# Altium schematic sheet Driver_1.SchDoc
size A4; SheetNumber: 2; SheetTotal: 7
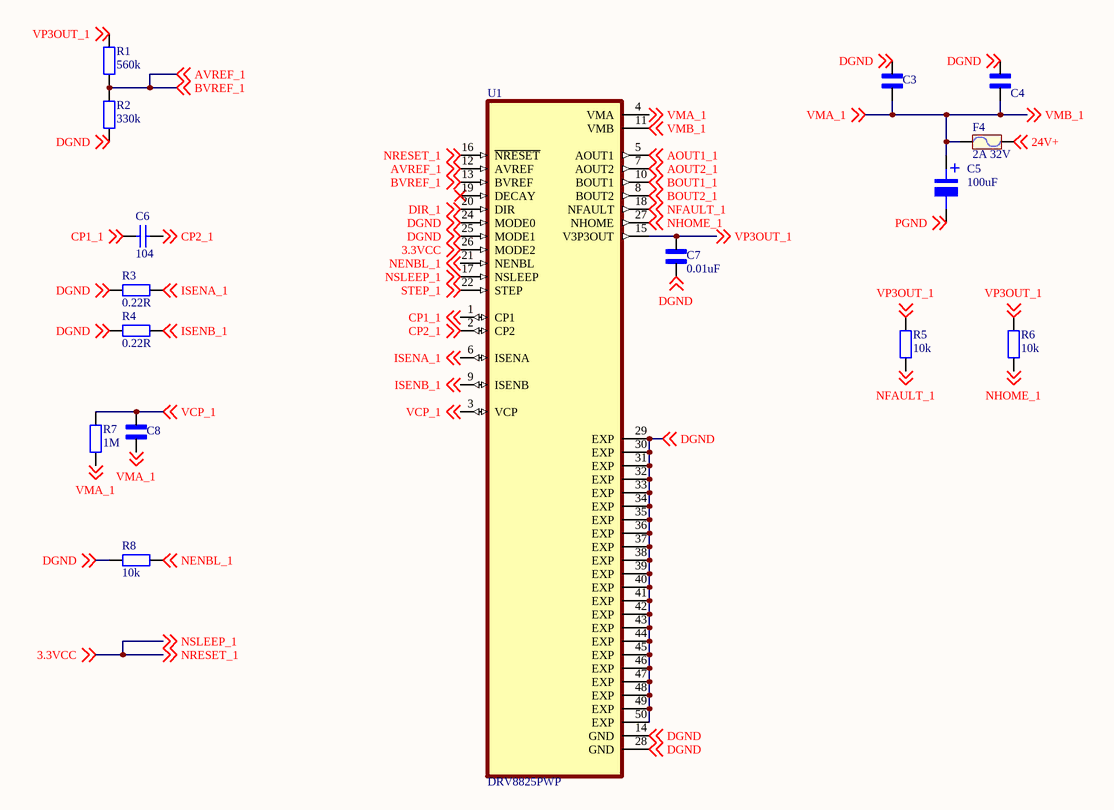
[diagram p0: Driver_1.SchDoc]

## Parts
C3  C0402C104K3RACTU  [CAPC1005X55N]  (value not drawn)
C4  C0402C104K3RACTU  [CAPC1005X55N]  (value not drawn)
C5  100uF  [tu nhom 6.3 (d)]
C6  104  [tu 1206]
C7  0.01uF  [CAPC1608X90N]
C8  C0402C104K3RACTU  [CAPC1005X55N]  (value not drawn)
F4  2A 32V  [Cau chi tu phuc hoi 2A 24V SMD1812]
R1  560k  [Tro SMD 0805]
R2  330k  [Tro SMD 0805]
R3  0.22R  [tro smd 0805]
R4  0.22R  [tro smd 0805]
R5  10k  [tro smd 0805]
R6  10k  [tro smd 0805]
R7  1M  [tro smd 0805]
R8  10k  [tro smd 0805]
U1  DRV8825PWP  [IC_TPS61196PWPRQ1]

## Nets
3.3VCC: U1.16(~{NRESET}) U1.17(NSLEEP) U1.26(MODE2) ; off-sheet 3.3VCC, off-sheet NRESET_1, off-sheet NSLEEP_1  [also labelled NRESET_1, NSLEEP_1]
24V+: F4.2 ; off-sheet 24V+
AOUT1_1: U1.5(AOUT1) ; off-sheet AOUT1_1
AOUT2_1: U1.7(AOUT2) ; off-sheet AOUT2_1
AVREF_1: R1.1 R2.2 U1.12(AVREF) U1.13(BVREF) ; off-sheet AVREF_1, off-sheet BVREF_1  [also labelled BVREF_1]
BOUT1_1: U1.10(BOUT1) ; off-sheet BOUT1_1
BOUT2_1: U1.8(BOUT2) ; off-sheet BOUT2_1
CP1_1: C6.1 U1.1(CP1) ; off-sheet CP1_1
CP2_1: C6.2 U1.2(CP2) ; off-sheet CP2_1
DGND: C3.2 C4.2 C7.1 R2.1 R3.1 R4.1 R8.1 U1.14(GND) U1.24(MODE0) U1.25(MODE1) U1.28(GND) U1.29(EXP) U1.30(EXP) U1.31(EXP) U1.32(EXP) U1.33(EXP) U1.34(EXP) U1.35(EXP) U1.36(EXP) U1.37(EXP) U1.38(EXP) U1.39(EXP) U1.40(EXP) U1.41(EXP) U1.42(EXP) U1.43(EXP) U1.44(EXP) U1.45(EXP) U1.46(EXP) U1.47(EXP) U1.48(EXP) U1.49(EXP) U1.50(EXP) ; off-sheet DGND
DIR_1: U1.20(DIR) ; off-sheet DIR_1
ISENA_1: R3.2 U1.6(ISENA) ; off-sheet ISENA_1
ISENB_1: R4.2 U1.9(ISENB) ; off-sheet ISENB_1
NENBL_1: R8.2 U1.21(NENBL) ; off-sheet NENBL_1
NFAULT_1: R5.1 U1.18(NFAULT) ; off-sheet NFAULT_1
NHOME_1: R6.1 U1.27(NHOME) ; off-sheet NHOME_1
PGND: C5.2 ; off-sheet PGND
STEP_1: U1.22(STEP) ; off-sheet STEP_1
VCP_1: C8.2 R7.2 U1.3(VCP) ; off-sheet VCP_1
VMA_1: C3.1 C4.1 C5.1 C8.1 F4.1 R7.1 U1.4(VMA) U1.11(VMB) ; off-sheet VMA_1, off-sheet VMB_1  [also labelled VMB_1]
VP3OUT_1: C7.2 R1.2 R5.2 R6.2 U1.15(V3P3OUT) ; off-sheet VP3OUT_1

Not connected (* = marked no-connect by the designer): U1 19(DECAY)*

## Notes on the sheet
- (in symbol Tu Nhom 100uF 16V) +

## Library data of the parts
C3 C4 C8 = C0402C104K3RACTU: MF: {'manufacturer': u'KEMET'}; Package: None; Price: None; Value: *; MP: C0402C104K3RACTU; Availability: Unavailable
C5 = Tu Nhom 100uF 16V: Dán; Don_Vi: Con; So_Chan: 2; Ten_Linh_Kien: Tụ Nhôm 100uF 16V 6.3x5.4MM; Ma_Hang: MH002219; Chung_Loai: Dán; Kieu_Chan: *
C6 = Tu 1206 104 50V 20%: Dán; Don_Vi: Con; So_Chan: 2; Ten_Linh_Kien: Tụ 1206 104-0.1uF 20% 50V; Ma_Hang: MH004544; Chung_Loai: Dán; Kieu_Chan: *
C7 = GCE188R72A103KA01D: 0603 0.01 uF 100 V Â±10% Tolerance X7R Multilayer Ceramic Capacitor; MF: Murata; Package: 1608 Murata; Check_prices: https://www.snapeda.com/parts/GCE188R72A103KA01D/Murata%20Electronics%20North%20America/view-part/1764845/?ref=eda; Value: *; Price: None; Purchase-URL: https://pricing.snapeda.com/search/part/GCE188R72A103KA01D/?ref=eda; MP: GCE188R72A103KA01D; Availability: Good; SnapEDA_Link: https://www.snapeda.com/parts/GCE188R72A103KA01D/Murata%20Electronics%20North%20America/view-part/1764845/?ref=snap
F4 = Cau chi tu phuc hoi 2A 24V SMD1812: 2A 24V SMD1812; Ma_Hang: MH010033; Ten: Cầu Chì Tự Phục Hồi 2A 24V SMD1812
R1 = Tro 0805 5% 560k: Dán; Don_Vi: Con; Ma_Hang: MH005342; Ten_Linh_Kien: Trở 0805 5% 560k; So_Chan: 2; Chung_Loai: Dán; Kieu_Chan: *
R2 = Tro 0805 5% 330k: Dán; Don_Vi: Con; So_Chan: 2; Ten_Linh_Kien: Trở 0805 5% 330K; Ma_Hang: MH005336; Chung_Loai: Dán; Kieu_Chan: *
R3 R4 = Tro 0805 1% 0.22R: Dán; Don_Vi: Con; So_Chan: 2; Ten_Linh_Kien: Trở 0805 1% 0.22R; Ma_Hang: MH005466; Chung_Loai: Dán; Kieu_Chan: *
R5 R6 R8 = Tro 0805 1% 10k: Dán; Don_Vi: Con; So_Chan: 2; Ten_Linh_Kien: Trở 0805 1% 10k; Ma_Hang: MH005473; Chung_Loai: Dán; Kieu_Chan: *
R7 = Tro 0805 1% 1M: Dán; Don_Vi: Con; So_Chan: 2; Ten_Linh_Kien: Trở 0805 1% 1M; Ma_Hang: MH005469; Chung_Loai: Dán; Kieu_Chan: *
U1 = DRV8825PWP: <a href="https://snapeda.com/parts/DRV8825PWP/Texas%20Instruments/view-part/?ref=eda">Buy Part</a>; Package: None; Availability: Unavailable; Value: *; MP: DRV8825PWP; Price: None